# Altium project PCB_DELIVERY BOX-IOT.PrjPcb
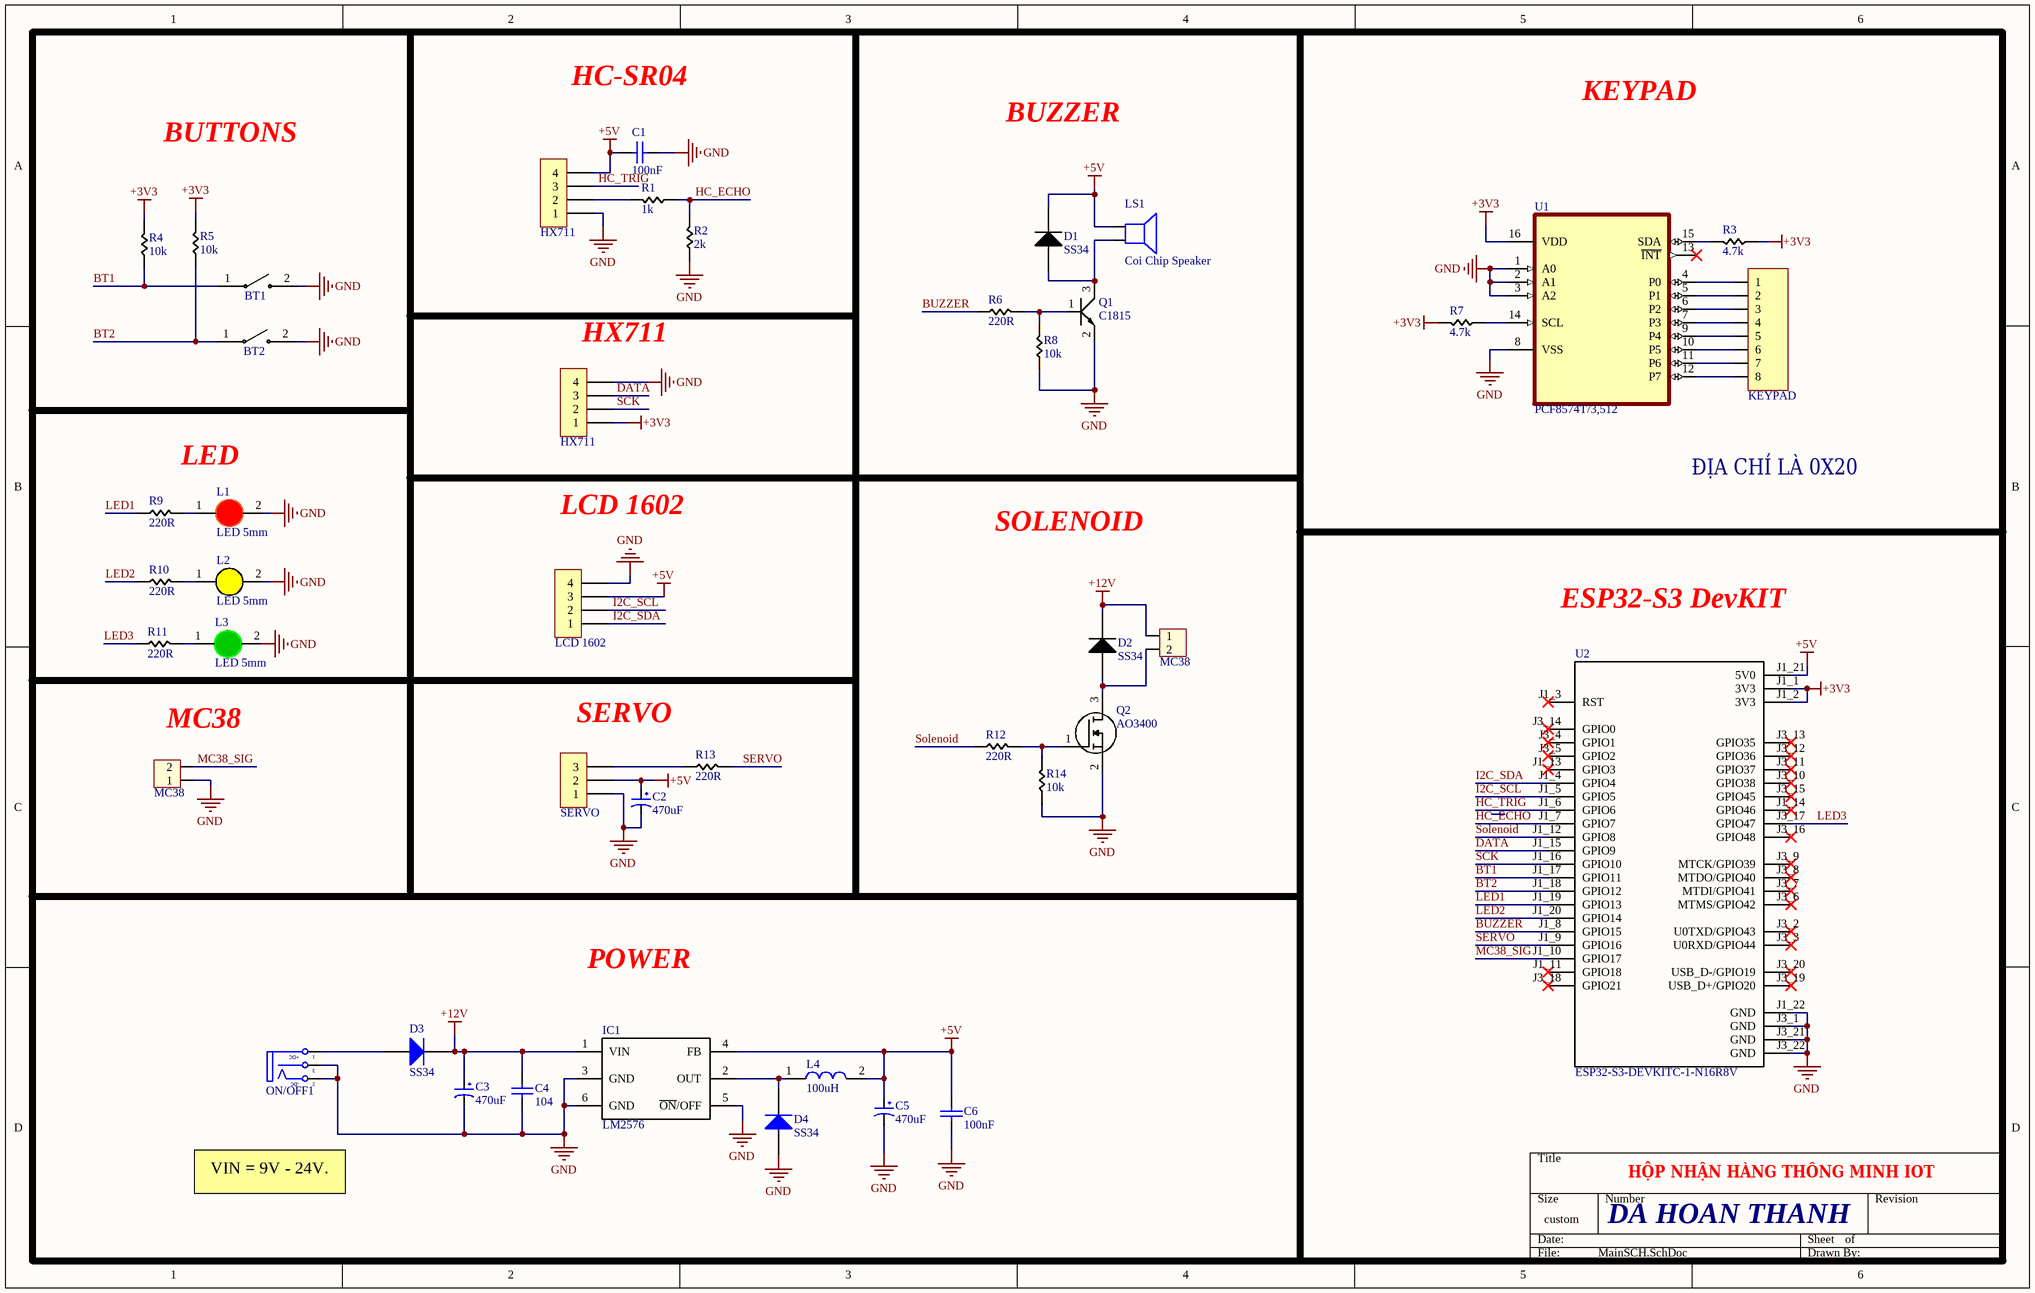
[diagram p0: MainSCH.SchDoc]
1 sheet, 44 parts. Net scope: global (net labels, ports and power ports of the same name join across sheets).
Board file: MainPCB.PcbDoc

## Sheet MainSCH.SchDoc
size 381 x 241 mm; SheetNumber: 1; SheetTotal: 1

### Parts
BT1  Button 2P SMD  [PUSH_BUTTON_6X6]  (value not drawn)
BT2  Button 2P SMD  [PUSH_BUTTON_6X6]  (value not drawn)
C1  100nF  [tu gom]
C2  470uF  [tu hoa 8mm]
C3  470uF  [tu hoa 8mm]
C4  104  [tu gom]
C5  470uF  [tu hoa 8mm]
C6  100nF  [tu gom]
D1  SS34  [DIODE (DO-214AB)]
D2  SS34  [DIODE (DO-214AB)]
D3  SS34  [DIODE SMA]
D4  SS34  [DIODE SMA]
H1  HX711  [XH2.54M-4]
H2  HX711  [XH2.54M-4]
H3  LCD 1602  [XH2.54M-4]
H4  MC38  [XH2.54M-2]
H5  SERVO  [XH2.54M-3]
H6  MC38  [XH2.54M-2]
IC1  LM2576  [TO-263-5]
JP1  KEYPAD  [JP 1x8 DT]
L1  LED 5mm  [LED-5MM-RED]
L2  LED 5mm  [LED-5MM-Yellow]
L3  LED 5mm  [LED-5MM-Green]
L4  100uH  [CDRH127 12x12x7]
LS1  Coi Chip Speaker  [Coi Chip Speacker]
ON/OFF1  POWER  [DC-IN]  (value not drawn)
Q1  C1815  [SOT-23]
Q2  AO3400  [SOT-23]
R1  1k  [tro smd 0805]
R2  2k  [tro smd 0805]
R3  4.7k  [tro smd 0805]
R4  10k  [tro smd 0805]
R5  10k  [tro smd 0805]
R6  220R  [tro smd 0805]
R7  4.7k  [tro smd 0805]
R8  10k  [tro smd 0805]
R9  220R  [tro smd 0805]
R10  220R  [tro smd 0805]
R11  220R  [tro smd 0805]
R12  220R  [tro smd 0805]
R13  220R  [tro smd 0805]
R14  10k  [tro smd 0805]
U1  PCF8574T/3,512  [SOIC127P1032X265-16N]
U2  ESP32-S3-DEVKITC-1-N16R8V  [ESP32-S3-DEVKITC-1-N16R8V]

### Nets
+3V3: H2.1 R3.1 R4.2 R5.2 R7.2 U1.16(VDD) U2.J1_1(3V3) U2.J1_2(3V3)
+5V: C1.1 C2.1 C5.1 C6.1 D1.2(K) H1.4 H3.3 H5.2 IC1.4(FB) L4.2 LS1.1 U2.J1_21(5V0)
+12V: C3.1 C4.1 D2.2(K) D3.2(K) H4.1 IC1.1(VIN)
GND: BT1.2 BT2.2 C1.2 C2.2 C3.2 C4.2 C5.2 C6.2 D4.1(A) H1.1 H2.4 H3.4 H5.1 H6.1 IC1.3(GND) IC1.5(~{ON}/OFF) IC1.6(GND) L1.2(K) L2.2(K) L3.2(K) ON/OFF1.2(TN) ON/OFF1.3(S) Q1.2(E) Q2.2(S) R2.1 R8.1 R14.1 U1.1(A0) U1.2(A1) U1.3(A2) U1.8(VSS) U2.J1_22(GND) U2.J3_1(GND) U2.J3_21(GND) U2.J3_22(GND)
BT1: BT1.1 R4.1 U2.J1_17(GPIO11)
BT2: BT2.1 R5.1 U2.J1_18(GPIO12)
BUZZER: R6.1 U2.J1_8(GPIO15)
DATA: H2.3 U2.J1_15(GPIO9)
HC_ECHO: R1.1 R2.2 U2.J1_7(GPIO7)
HC_TRIG: H1.3 U2.J1_6(GPIO6)
I2C_SCL: H3.2 U2.J1_5(GPIO5)
I2C_SDA: H3.1 U2.J1_4(GPIO4)
LED1: R9.1 U2.J1_19(GPIO13)
LED2: R10.1 U2.J1_20(GPIO14)
LED3: R11.1 U2.J3_17(GPIO47)
MC38_SIG: H6.2 U2.J1_10(GPIO17)
SCK: H2.2 U2.J1_16(GPIO10)
SERVO: R13.2 U2.J1_9(GPIO16)
Solenoid: R12.1 U2.J1_12(GPIO8)
NetD1_1: D1.1(A) LS1.2 Q1.3(C)
NetD2_1: D2.1(A) H4.2 Q2.3(D)
NetD3_1: D3.1(A) ON/OFF1.1(T)
NetD4_2: D4.2(K) IC1.2(OUT) L4.1
NetH1_2: H1.2 R1.2
NetH5_3: H5.3 R13.1
NetJP1_1: JP1.1 U1.4(P0)
NetJP1_2: JP1.2 U1.5(P1)
NetJP1_3: JP1.3 U1.6(P2)
NetJP1_4: JP1.4 U1.7(P3)
NetJP1_5: JP1.5 U1.9(P4)
NetJP1_6: JP1.6 U1.10(P5)
NetJP1_7: JP1.7 U1.11(P6)
NetJP1_8: JP1.8 U1.12(P7)
NetL1_1: L1.1(A) R9.2
NetL2_1: L2.1(A) R10.2
NetL3_1: L3.1(A) R11.2
NetQ1_1: Q1.1(B) R6.2 R8.2
NetQ2_1: Q2.1(G) R12.2 R14.2
NetR3_2: R3.2 U1.15(SDA)
NetR7_1: R7.1 U1.14(SCL)

Not connected (* = marked no-connect by the designer): U1 13(~{INT})*; U2 J1_3(RST)* J1_11(GPIO18)* J1_13(GPIO3)* J1_14(GPIO46)* J3_2(U0TXD/GPIO43)* J3_3(U0RXD/GPIO44)* J3_4(GPIO1)* J3_5(GPIO2)* J3_6(MTMS/GPIO42)* J3_7(MTDI/GPIO41)* J3_8(MTDO/GPIO40)* J3_9(MTCK/GPIO39)* J3_10(GPIO38)* J3_11(GPIO37)* J3_12(GPIO36)* J3_13(GPIO35)* J3_14(GPIO0)* J3_15(GPIO45)* J3_16(GPIO48)* J3_18(GPIO21)* J3_19(USB_D+/GPIO20)* J3_20(USB_D-/GPIO19)*

### Notes on the sheet
- HC-SR04
- BUTTONS
- BUZZER
- KEYPAD
- (near H2) HX711
- LED
- ĐỊA CHỈ LÀ 0X20
- LCD 1602
- SOLENOID
- ESP32-S3 DevKIT
- (near H6) MC38
- (near H5) SERVO
- POWER
- HỘP NHẬN HÀNG THÔNG MINH IOT
- VIN = 9V - 24V.
- DA HOAN THANH
- (in symbol DCIN) +DC; -DC

### Library data of the parts
BT1 BT2 = Button 2P SMD: Push Button Tactile Switch SMD 2 Pins 3x4x2mm.; JLCPCB PN: C231644
C1 C4 C6 = Tu gom 104 50V: Cắm; So_Chan: 2; Ten_Linh_Kien: Tụ gốm 104 100nF 50V; Don_Vi: Con; Ma_Hang: MH004761; Chung_Loai: Cắm; Kieu_Chan: *
C2 = Tu Hoa 470uF 16V 8x11: Cắm; Don_Vi: Con; So_Chan: 2; Ten_Linh_Kien: Tụ Hóa 470uF 16V 8x11MM; Ma_Hang: MH006550; Chung_Loai: Cắm; Kieu_Chan: *
C3 C5 = Tu Hoa 470uF 25V 8x13: Cắm; Don_Vi: Con; So_Chan: 2; Ten_Linh_Kien: Tụ Hóa 470uF 25V; Ma_Hang: MH 470uF 25V; Chung_Loai: Cắm; Kieu_Chan: *
D1 D2 = Diode SS34: Diode SS34 ( 1N5822 ), DO-214AB; Don_Vi: Con; Chung_Loai: Dán; Ma_Hang: MH002104; Ten_Linh_Kien: Diode SS34 3A 40V SMA ( 1N5822 SS34A); Kieu_Chan: *
D3 D4 = Diode SS34 ( 1N5822 ): Dán; Don_Vi: Con; Ma_Hang: MH002104; Ten_Linh_Kien: Diode SS34 3A 40V SMA ( 1N5822 SS34A); Kieu_Chan: *; Chung_Loai: Dán
H1-H3 = Header 4P 2.54 Duc Thang: Cắm; Ten_Linh_Kien: Header 4P XH2.54-4P Đực Thẳng; Don_Vi: Con; Ma_Hang: MH001285; Chung_Loai: Cắm
H4 H6 = Header 2P 2.54 Duc Thang: Cắm; Ten_Linh_Kien: Header 2P XH2.54-2P Đực Thẳng; Don_Vi: Con; Ma_Hang: MH001283; Chung_Loai: Cắm
H5 = Header 3P 2.54 Duc Thang: Cắm; Ten_Linh_Kien: Header 3P XH2.54-3P Đực Thẳng; Don_Vi: Con; Ma_Hang: MH001292; Chung_Loai: Cắm
IC1 = LM2576 SMD: LM2576 SMD AND ADJ (TO-263-5)
JP1 = JP 1x8 2.54 Duc Thang: Cắm; Ten_Linh_Kien: Jump Đơn Đực 2.54MM 1x40P Thẳng 11MM; Don_Vi: Con; Ma_Hang: MH000903; Ghi_Chu: *; Kieu_Chan: *; Chung_Loai: Cắm
L1 = LED 5mm Do: Cắm; Don_Vi: Con; Ma_Hang: MH008967; Ten_Linh_Kien: Led 5MM Phủ Đỏ (1000c); Ghi_Chu: *; Kieu_Chan: *; Chung_Loai: Cắm
L2 = LED 5mm Vang: Cắm; Don_Vi: Con; Ma_Hang: MH008968; Ten_Linh_Kien: Led 5MM Phủ Vàng (1000c); Ghi_Chu: *; Kieu_Chan: *; Chung_Loai: Cắm
L3 = LED 5mm Xanh La: Cắm; Don_Vi: Con; Ma_Hang: MH008969; Ten_Linh_Kien: LED 5MM Phủ Xanh (1000c); Ghi_Chu: *; Kieu_Chan: *; Chung_Loai: Cắm
L4 = Cuon Cam
LS1 = Coi Chip Speaker: Còi chip
ON/OFF1 = DCIN
Q1 = C1815: SOT-23; Ten_Linh_Kien: C1815 SOT23 TRANS NPN 0.15A 50V (SMD-HF); Don_Vi: Con; Ma_Hang: MH000946; Chung_Loai: Dán; Ghi_Chu: *; Kieu_Chan: *
Q2 = MOSFET AO3400: N-Channel 30 V 5.8A (Ta) 1.4W (Ta) SOT-23-3; MF: Alpha &; SnapEDA_Link: https://www.snapeda.com/parts/AO3400/Alpha+%2526+Omega+Semiconductor+Inc./view-part/?ref=snap; Package: SOT-23-3 Alpha &amp; Omega Semiconductor; Value: *; MP: AO3400; Check_prices: https://www.snapeda.com/parts/AO3400/Alpha+%2526+Omega+Semiconductor+Inc./view-part/?ref=eda
R1-R14 = Tro 0805: Tro 0805 Dán; Don_Vi: Con; So_Chan: 2; Ten_Linh_Kien: Trở 0603 1% 0R; Ma_Hang: MH005792; Chung_Loai: Dán; Kieu_Chan: *
U1 = PCF8574T/3,512: I/O Expander 8 IÂ²C 100 kHz 16-SO; MF: NXP USA; SnapEDA_Link: https://www.snapeda.com/parts/PCF8574T/3,512/NXP+USA+Inc./view-part/?ref=snap; Check_prices: https://www.snapeda.com/parts/PCF8574T/3,512/NXP+USA+Inc./view-part/?ref=eda; Availability: In Stock; MP: PCF8574T/3,512; Package: SOIC-16 NXP Semiconductors; Purchase-URL: https://pricing.snapeda.com/search/part/PCF8574T/3,512/?ref=eda; Value: *; Price: None
U2 = ESP32-S3-DEVKITC-1-N16R8V: Development Boards & Kits - Wireless Gen-Purpose Dev Board, embeds ESP32-S3-WROOM-2-N16R8V, 16 MB Octal Flash, 8 MB Octal PSRAM, with Pin Header